# EAGLE schematic 315mhz_i2c_v1 (EAGLE 9.6.2)
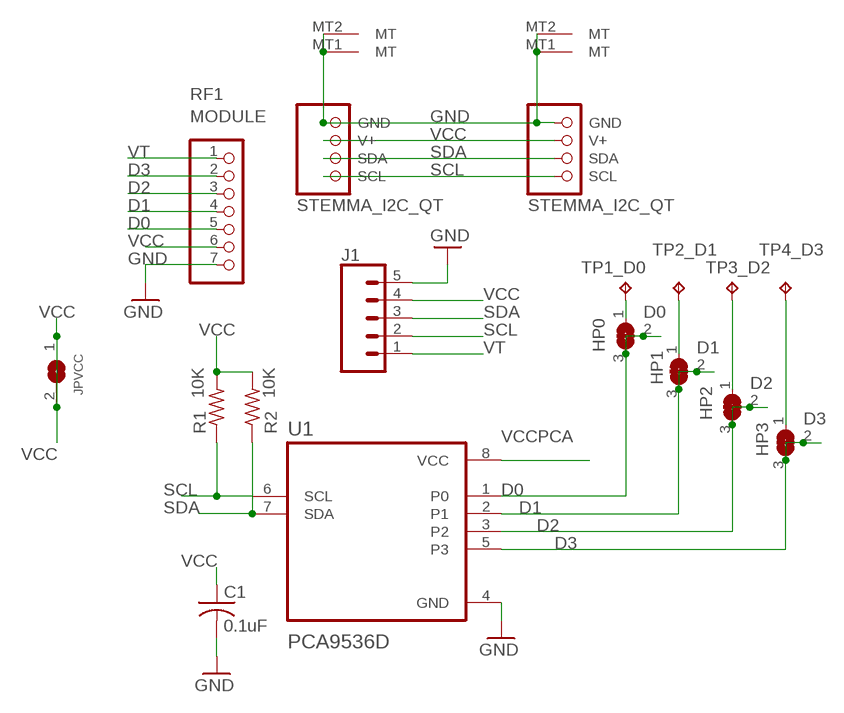
[diagram p0: schematic, sheet 1]

## Parts
C1  0.1uF  C-USC0805  [C0805]
CONN3  STEMMA_I2C_QT  [JST_SH4]
CONN4  STEMMA_I2C_QT  [JST_SH4]
HP0  SOLDERJUMPER_2WAY  [SOLDERJUMPER_2WAY_OPEN_NOPASTE]
HP1  SOLDERJUMPER_2WAY  [SOLDERJUMPER_2WAY_OPEN_NOPASTE]
HP2  SOLDERJUMPER_2WAY  [SOLDERJUMPER_2WAY_OPEN_NOPASTE]
HP3  SOLDERJUMPER_2WAY  [SOLDERJUMPER_2WAY_OPEN_NOPASTE]
J1  CONN_05NO_SILK  [1X05_NO_SILK]
JPVCC  SOLDERJUMPERCLOSED  [SOLDERJUMPER_CLOSEDWIRE]
R1  10K  R-US_R0805  [R0805]
R2  10K  R-US_R0805  [R0805]
RF1  MODULE  PINHD-1X7  [1X07]
TP1_D0  TPTP12R  [TP12R]
TP2_D1  TPTP12R  [TP12R]
TP3_D2  TPTP12R  [TP12R]
TP4_D3  TPTP12R  [TP12R]
U1  PCA9536D  [SOIC127P599X175-8N]

## Nets
D0: HP0.2 HP0.3 RF1.5 U1.1(P0)
D1: HP1.2 HP1.3 RF1.4 U1.2(P1)
D2: HP2.2 HP2.3 RF1.3 U1.3(P2)
D3: HP3.2 HP3.3 RF1.2 U1.5(P3)
GND [highpower]: C1.2 CONN3.1(GND) CONN3.MT1(MT) CONN3.MT2(MT) CONN4.1(GND) CONN4.MT1(MT) CONN4.MT2(MT) J1.5 RF1.7 U1.4(GND)
N$1: HP0.1 TP1_D0.TP
N$2: HP1.1 TP2_D1.TP
N$3: HP2.1 TP3_D2.TP
N$4: HP3.1 TP4_D3.TP
SCL: CONN3.4(SCL) CONN4.4(SCL) J1.2 R1.1 U1.6(SCL)
SDA: CONN3.3(SDA) CONN4.3(SDA) J1.3 R2.1 U1.7(SDA)
VCC: C1.1 CONN3.2(V+) CONN4.2(V+) J1.4 JPVCC.1 JPVCC.2 R1.2 R2.2 RF1.6
VCCPCA: U1.8(VCC)
VT: J1.1 RF1.1

## Library data of the parts
C1 = adafruit:C-US: CAPACITOR, American symbol
CONN3 CONN4 = microbuilder:STEMMA_I2C
HP0 HP1-HP3 = microbuilder:SOLDERJUMPER_2WAY: 2-Way Solder Jumper
J1 = SparkFun-Connectors:CONN_05: Multi connection point. Often used as Generic Header-pin footprint for 0.1 inch spaced/style header connections On any of the 0.1 inch spaced packages, you can populate with these: Break Away Headers - Straight <https://www.sparkfun.com/products/116> (PRT-00116) Break Away Male Headers - Right Angle <https://www.sparkfun.com/products/553> (PRT-00553) Female Headers <https://www.sparkfun.com/products/115> (PRT-00115) Break Away Headers - Machine Pin <https://www.sparkfun.com/products/117> (PRT-00117) Break Away Female Headers - Swiss Machine Pin <https://www.sparkfun.com/products/743> (PRT-00743) For SCREWTERMINALS and SPRING TERMINALS visit here: Screw Terimnals on SparkFun.com <https://www.sparkfun.com/search/results?term=Screw+Terminals> (5mm/3.5mm/2.54mm spacing) This device is also useful as a general connection point to wire up your design to another part of your project. Our various solder wires solder well into these plated through hole pads. Hook-Up Wire - Assortment (Stranded, 22 AWG) <https://www.sparkfun.com/products/11375> (PRT-11375) Hook-Up Wire - Assortment (Solid Core, 22 AWG) <https://www.sparkfun.com/products/11367> (PRT-11367) View the entire wire category on our website here <https://www.sparkfun.com/categories/141> Special notes: Molex polarized connector foot print use with SKU : PRT-08231 with associated crimp pins and housings. 1MM SMD Version SKU: PRT-10208
JPVCC = microbuilder:SOLDERJUMPER: SMD Solder JUMPER Solder the two pads together to create a connection, or remove the solder to break it. REFLOW - Use this footprint for solder paste and reflow ovens. WAVE - Use this footprint for hand-soldering (larger pads). CLOSED - Has a trace between the two pads to ensure it is closed by default. The trace needs to be cut to disable the jumper, and can be closed again by creating a solder bridge between the two pads.
R1 R2 = adafruit:R-US_: RESISTOR, American symbol
RF1 = pinhead:PINHD-1X7: PIN HEADER
TP1_D0 TP2_D1 TP3_D2 TP4_D3 = testpad:TP: Test pad
U1 = PCA9536D:PCA9536D: Check availability <https://pricing.snapeda.com/parts/PCA9536D/Texas%20Instruments/view-part?ref=eda>; AVAILABILITY: In Stock; CHECK_PRICES: https://www.snapeda.com/parts/PCA9536D/Texas+Instruments/view-part/?ref=eda; DESCRIPTION: 4-bit 2.3- to 5.5-V I2C/SMBus I/O expander with config registers; MF: Texas Instruments; MP: PCA9536D; PACKAGE: SOIC-8 Texas Instruments; PRICE: None; PURCHASE-URL: https://www.snapeda.com/api/url_track_click_mouser/?unipart_id=1110294&manufacturer=Texas Instruments&part_name=PCA9536D&search_term=None; SNAPEDA_LINK: https://www.snapeda.com/parts/PCA9536D/Texas+Instruments/view-part/?ref=snap

## Net classes
1 highpower: width 0.305 mm, drill 0.483 mm
2 gnd: width 0.254 mm